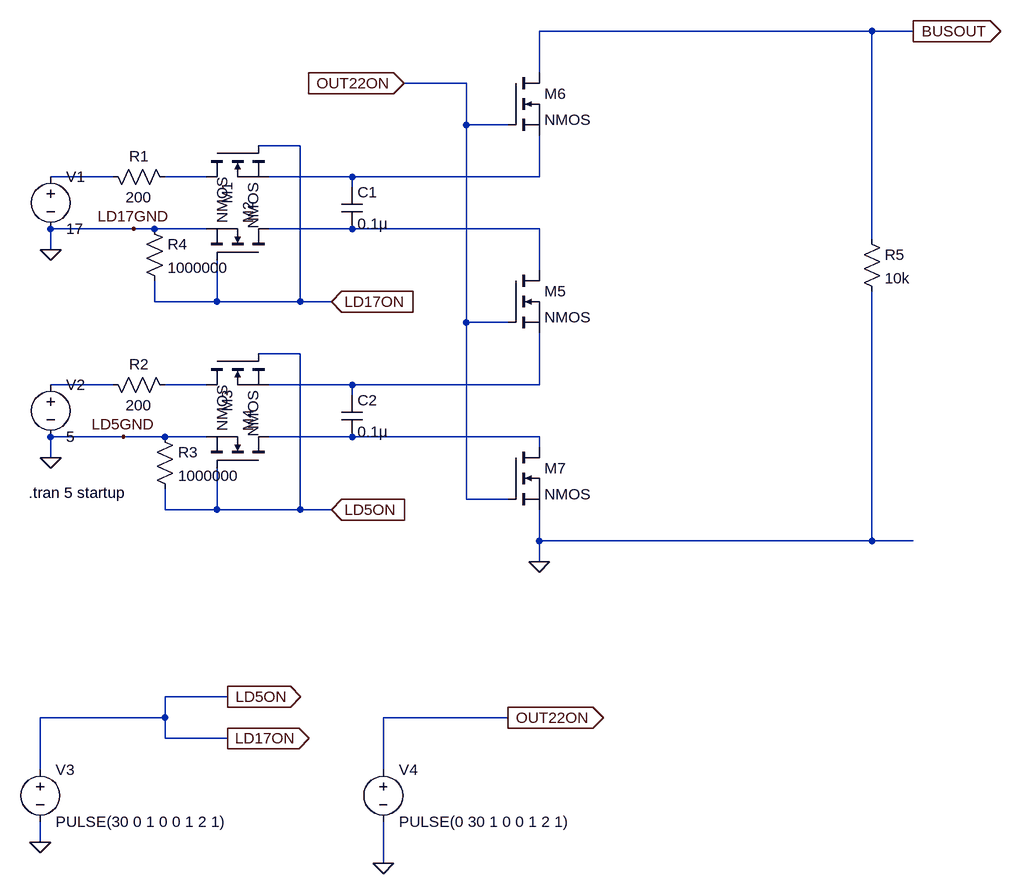
[diagram p0: schematic Driver3.asc]
Driver3.asc, the LTspice schematic file:
Version 4
SHEET 1 2516 1212
WIRE 928 -224 416 -224
WIRE 992 -224 928 -224
WIRE 416 -160 416 -224
WIRE 304 -144 208 -144
WIRE 304 -80 304 -144
WIRE 368 -80 304 -80
WIRE 48 -48 -16 -48
WIRE -240 0 -336 0
WIRE -96 0 -160 0
WIRE 128 0 0 0
WIRE 416 0 416 -64
WIRE 416 0 128 0
WIRE 128 16 128 0
WIRE -208 80 -336 80
WIRE -176 80 -208 80
WIRE -96 80 -176 80
WIRE 128 80 0 80
WIRE 416 80 128 80
WIRE 928 96 928 -224
WIRE -336 112 -336 80
WIRE 416 144 416 80
WIRE -176 192 -176 160
WIRE -80 192 -80 128
WIRE -80 192 -176 192
WIRE 48 192 48 -48
WIRE 48 192 -80 192
WIRE 96 192 48 192
WIRE 304 224 304 -80
WIRE 368 224 304 224
WIRE 48 272 -16 272
WIRE -240 320 -336 320
WIRE -96 320 -160 320
WIRE 128 320 0 320
WIRE 416 320 416 240
WIRE 416 320 128 320
WIRE 128 336 128 320
WIRE -224 400 -336 400
WIRE -160 400 -224 400
WIRE -96 400 -160 400
WIRE 128 400 0 400
WIRE 416 400 128 400
WIRE 416 416 416 400
WIRE -336 432 -336 400
WIRE 304 496 304 224
WIRE 368 496 304 496
WIRE -160 512 -160 480
WIRE -80 512 -80 448
WIRE -80 512 -160 512
WIRE 48 512 48 272
WIRE 48 512 -80 512
WIRE 96 512 48 512
WIRE 416 560 416 512
WIRE 928 560 928 176
WIRE 928 560 416 560
WIRE 992 560 928 560
WIRE 416 592 416 560
WIRE -64 800 -160 800
WIRE -160 832 -160 800
WIRE -160 832 -352 832
WIRE 368 832 176 832
WIRE -160 864 -160 832
WIRE -64 864 -160 864
WIRE -352 912 -352 832
WIRE 176 912 176 832
WIRE -352 1024 -352 992
WIRE 176 1056 176 992
FLAG 96 192 LD17ON
IOPIN 96 192 In
FLAG 96 512 LD5ON
IOPIN 96 512 In
FLAG 208 -144 OUT22ON
IOPIN 208 -144 In
FLAG 416 592 0
FLAG 992 -224 BUSOUT
IOPIN 992 -224 Out
FLAG -64 800 LD5ON
IOPIN -64 800 Out
FLAG -64 864 LD17ON
IOPIN -64 864 Out
FLAG 368 832 OUT22ON
IOPIN 368 832 Out
FLAG -224 400 LD5GND
FLAG -208 80 LD17GND
FLAG 176 1056 0
FLAG -352 1024 0
FLAG -336 112 0
FLAG -336 432 0
SYMBOL cap 112 16 R0
SYMATTR InstName C1
SYMATTR Value 0.1µ
SYMATTR SpiceLine V=4 Irms=1.62 Rser=0.0464862 Lser=0 mfg="KEMET" pn="C0402C104K7PAC" type="X5R"
SYMBOL voltage -336 -16 R0
WINDOW 123 0 0 Left 0
WINDOW 39 0 0 Left 0
SYMATTR InstName V1
SYMATTR Value 17
SYMBOL res -256 -16 M90
WINDOW 0 0 56 VBottom 2
WINDOW 3 32 56 VTop 2
SYMATTR InstName R1
SYMATTR Value 200
SYMBOL nmos -96 -48 M90
SYMATTR InstName M1
SYMBOL nmos 0 128 M270
SYMATTR InstName M2
SYMBOL cap 112 336 R0
SYMATTR InstName C2
SYMATTR Value 0.1µ
SYMATTR SpiceLine V=4 Irms=1.62 Rser=0.0464862 Lser=0 mfg="KEMET" pn="C0402C104K7PAC" type="X5R"
SYMBOL voltage -336 304 R0
WINDOW 123 0 0 Left 0
WINDOW 39 0 0 Left 0
SYMATTR InstName V2
SYMATTR Value 5
SYMBOL res -256 304 M90
WINDOW 0 0 56 VBottom 2
WINDOW 3 32 56 VTop 2
SYMATTR InstName R2
SYMATTR Value 200
SYMBOL nmos -96 272 M90
SYMATTR InstName M3
SYMBOL nmos 0 448 M270
SYMATTR InstName M4
SYMBOL nmos 368 144 R0
SYMATTR InstName M5
SYMBOL nmos 368 -160 R0
SYMATTR InstName M6
SYMBOL nmos 368 416 R0
SYMATTR InstName M7
SYMBOL voltage -352 896 R0
WINDOW 123 0 0 Left 0
WINDOW 39 0 0 Left 0
SYMATTR InstName V3
SYMATTR Value PULSE(30 0 1 0 0 1 2 1)
SYMBOL voltage 176 896 R0
WINDOW 123 0 0 Left 0
WINDOW 39 0 0 Left 0
SYMATTR InstName V4
SYMATTR Value PULSE(0 30 1 0 0 1 2 1)
SYMBOL res -176 384 R0
SYMATTR InstName R3
SYMATTR Value 1000000
SYMBOL res -192 64 R0
SYMATTR InstName R4
SYMATTR Value 1000000
SYMBOL res 912 80 R0
SYMATTR InstName R5
SYMATTR Value 10k
TEXT -370 486 Left 2 !.tran 5 startup

The netlist it stands for:
* Driver3.asc
C1 N003 N004 0.1µ V=4 Irms=1.62 Rser=0.0464862 Lser=0 mfg="KEMET" pn="C0402C104K7PAC" type="X5R"
V1 N001 0 17
R1 N001 N002 200
M1 N002 LD5ON N003 N003 NMOS
M2 N004 LD5ON 0 0 NMOS
C2 N007 N008 0.1µ V=4 Irms=1.62 Rser=0.0464862 Lser=0 mfg="KEMET" pn="C0402C104K7PAC" type="X5R"
V2 N005 0 5
R2 N005 N006 200
M3 N006 LD5ON N007 N007 NMOS
M4 N008 LD5ON 0 0 NMOS
M5 N004 OUT22ON N007 N007 NMOS
M6 BUSOUT OUT22ON N003 N003 NMOS
M7 N008 OUT22ON 0 0 NMOS
V3 LD5ON 0 PULSE(30 0 1 0 0 1 2 1)
V4 OUT22ON 0 PULSE(0 30 1 0 0 1 2 1)
R3 0 LD5ON 1000000
R4 0 LD5ON 1000000
R5 BUSOUT 0 10k
.model NMOS NMOS
.model PMOS PMOS
.lib standard.mos
.tran 5 startup
.backanno
.end